# Altium schematic sheet turn-signal-indicator_E1_block-diagram.SchDoc: Звуковой сигнализатор
size 420 x 297 mm; CheckedBy: Семенцов С.Г.; Author: Советников М.М.; SheetNumber: 2; SheetTotal: 2; Title2str: указателя поворотов; DocumentType: Схема электрическая структурная
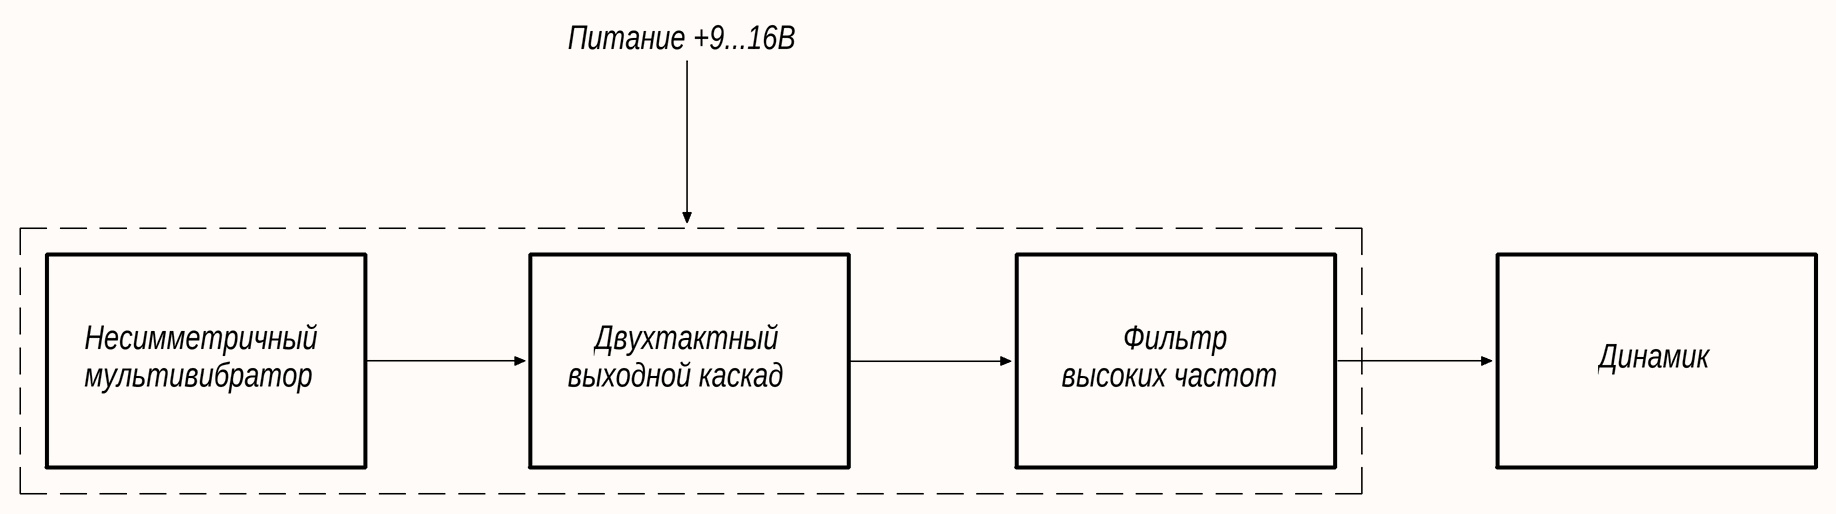
[diagram p0: turn-signal-indicator_E1_block-diagram.SchDoc]

## Notes on the sheet
- Питание +9...16В
- Несимметричный
- Двухтактный
- Фильтр
- мультивибратор
- выходной каскад
- высоких частот
- Динамик
- ИУ4.11.03.03.24.05.52.18.001 Э1
- ИУ4.11.03.03.24.05.52.18.001
- Перв. примен.
- Справ. №
- Подп. и дата
- Инв. № дубл.
- Взам. инв. №
- Разраб.
- Изм.
- Лист
- № докум.
- Подп.
- Дата
- Лит.
- Масса
- Масштаб
- Пров.
- Т.контр.
- Листов
- 1
- Инв. № подл.
- Утв.
- Н.контр.
- Кафедра ИУ4
- Группа ИУ4-52Б
- МГТУ им. Н.Э. Баумана
- 2.106-A3
- Копировал
- Формат А3